# Altium schematic sheet Sheet1.SchDoc: ИЛ1424ТО1/1
size 410 x 297 mm; ApprovedBy: Стерхов В.Д; CheckedBy: Стерхов В.Д; Author: Сергеев Д.А.; CompanyName: ГК "СНАБЖЕНИЕ"; DrawnBy: Сергеев Д.А.; Engineer: Сергеев Д.А.; Organization: ГК "СНАБЖЕНИЕ"; DocumentNumber: ИЛ1424ТО1/1; SheetNumber: 1; SheetTotal: 1
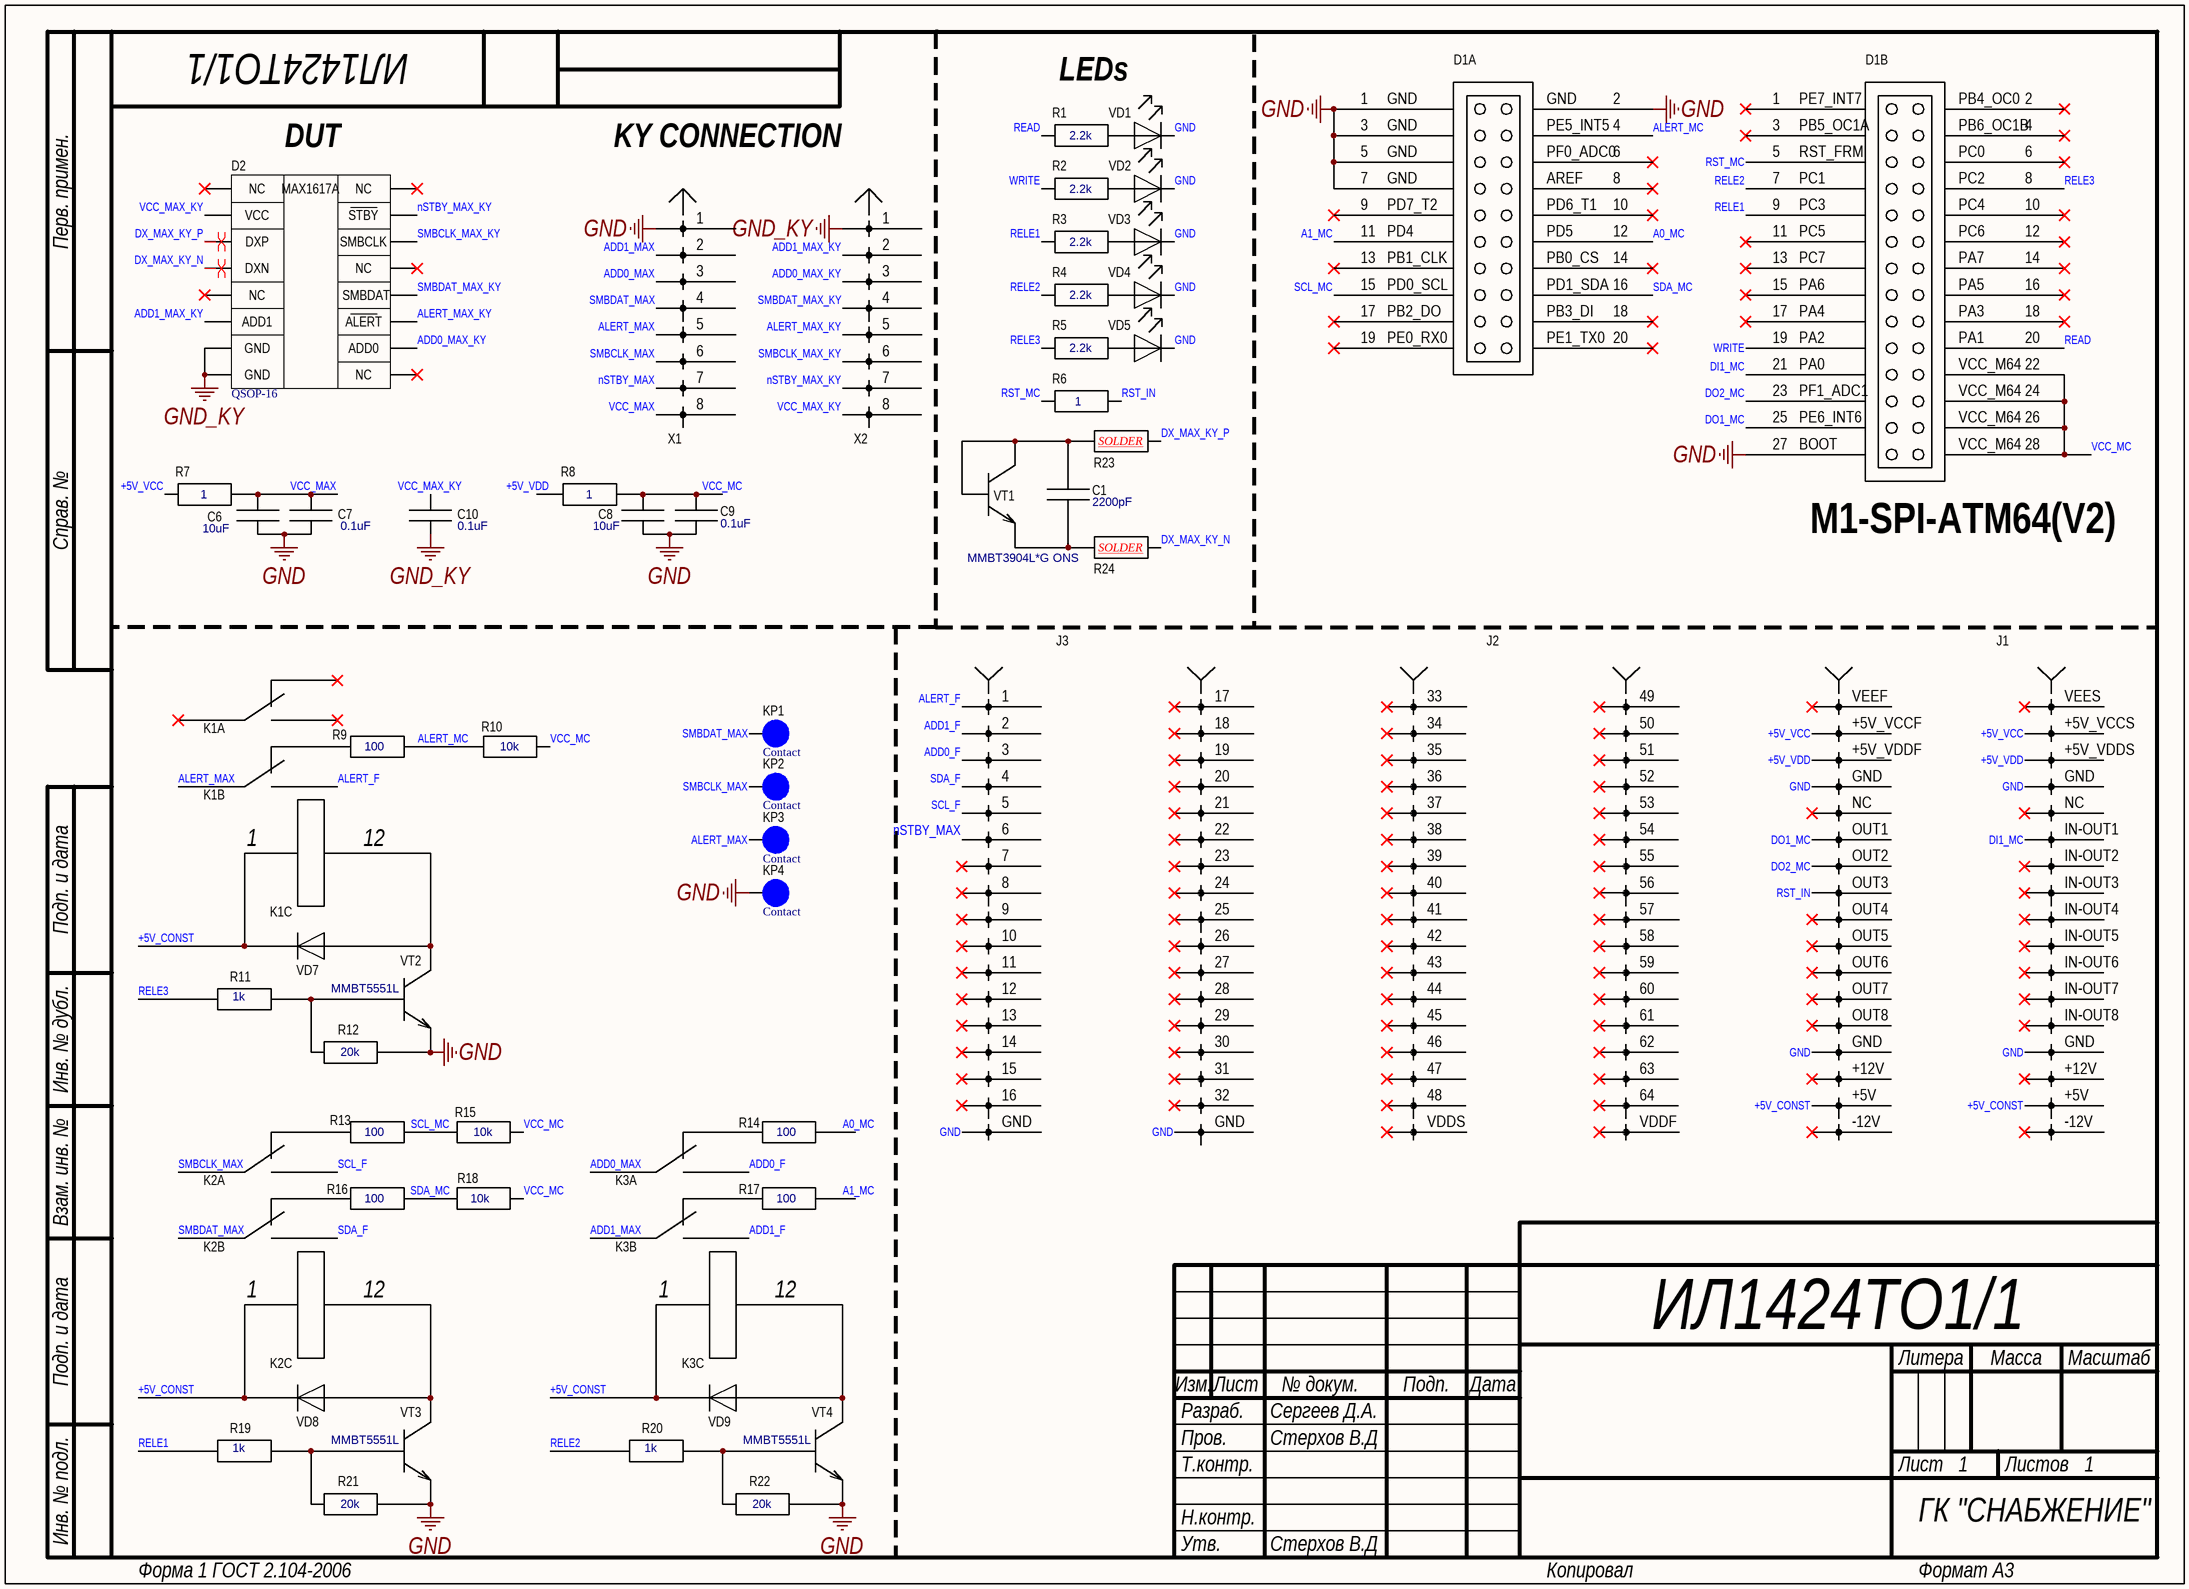
[diagram p0: Sheet1.SchDoc]

## Parts
C1  2200pF  [0603]
C6  10uF  [0805]
C7  0.1uF  [0805]
C8  10uF  [0805]
C9  0.1uF  [0805]
C10  0.1uF  [0805]
D1  M1-SPI-ATM64(V2)  [M1-SPI-ATM64(V2)]  (value not drawn)  (parts A,B of 2)
D2  QSOP-16  [QSOP-16 to DIP-7.62]
K1  V23079A1001B301 TE  [V23079A1001B301]  (value not drawn)  (parts A,B,C of 3)
K2  V23079A1001B301 TE  [V23079A1001B301]  (value not drawn)  (parts A,B,C of 3)
K3  V23079A1001B301 TE  [V23079A1001B301]  (value not drawn)  (parts A,B,C of 3)
KP1  Contact  [Contact]
KP2  Contact  [Contact]
KP3  Contact  [Contact]
KP4  Contact  [Contact]
R1  2.2k  [0805]
R2  2.2k  [0805]
R3  2.2k  [0805]
R4  2.2k  [0805]
R5  2.2k  [0805]
R6  1  [0805]
R7  1  [0805]
R8  1  [0805]
R9  100  [0805]
R10  10k  [0805]
R11  1k  [0805]
R12  20k  [0805]
R13  100  [0805]
R14  100  [0805]
R15  10k  [0805]
R16  100  [0805]
R17  100  [0805]
R18  10k  [0805]
R19  1k  [0805]
R20  1k  [0805]
R21  20k  [0805]
R22  20k  [0805]
R23  SOLDER  [0603]
R24  SOLDER  [0603]
VD1  LED(0805)  [0805(LED)]  (value not drawn)
VD2  LED(0805)  [0805(LED)]  (value not drawn)
VD3  LED(0805)  [0805(LED)]  (value not drawn)
VD4  LED(0805)  [0805(LED)]  (value not drawn)
VD5  LED(0805)  [0805(LED)]  (value not drawn)
VD7  LL4148 NXP  [SOD80C]  (value not drawn)
VD8  LL4148 NXP  [SOD80C]  (value not drawn)
VD9  LL4148 NXP  [SOD80C]  (value not drawn)
VT1  MMBT3904L*G ONS  [SOT-23]
VT2  MMBT5551L  [SOT-23]
VT3  MMBT5551L  [SOT-23]
VT4  MMBT5551L  [SOT-23]
X1  PLD8-2,54  [PLD8-2,54]  (value not drawn)
X2  PLD8-2,54  [PLD8-2,54]  (value not drawn)
X3  FORMULA  [FORMULA]  (value not drawn)

## Nets
GND: C6.2 C7.2 C8.2 C9.2 D1.1X2 D1.2X2 D1.3X2 D1.5X2 D1.7X2 D1.27X3 KP4.1 R12.2 R21.2 R22.2 VD1.2(K) VD2.2(K) VD3.2(K) VD4.2(K) VD5.2(K) VT2.2(E) VT3.2(E) VT4.2(E) X1.1 X3.GND
GND_KY: C10.2 D2.7 D2.8 X2.1
+5V_CONST: K1.1 K2.1 K3.1 VD7.2(K) VD8.2(K) VD9.2(K) X3.+5V
+5V_VCC: R7.1 X3.+5V_VCCF(VCCF) X3.+5V_VCCS(VCCS)
+5V_VDD: R8.1 X3.+5V_VDDF(VDDF) X3.+5V_VDDS(VDDS)
A0_MC: D1.12X2 R14.2
A1_MC: D1.11X2 R17.2
ADD0_F: K3.5 X3.3
ADD0_MAX: K3.4 X1.3
ADD0_MAX_KY: D2.10 X2.3
ADD1_F: K3.8 X3.2
ADD1_MAX: K3.9 X1.2
ADD1_MAX_KY: D2.6 X2.2
ALERT_F: K1.8 X3.1
ALERT_MAX: K1.9 KP3.1 X1.5
ALERT_MAX_KY: D2.11 X2.5
ALERT_MC: D1.4X2 R9.2 R10.1
DI1_MC: D1.21X3 X3.IN-OUT1
DO1_MC: D1.25X3 X3.OUT1
DO2_MC: D1.23X3 X3.OUT2
DX_MAX_KY_N: D2.4 R24.2
DX_MAX_KY_P: D2.3 R23.2
nSTBY_MAX: X1.7 X3.6
nSTBY_MAX_KY: D2.15 X2.7
READ: D1.20X3 R1.1
RELE1: D1.9X3 R3.1 R19.1
RELE2: D1.7X3 R4.1 R20.1
RELE3: D1.8X3 R5.1 R11.1
RST_IN: R6.2 X3.OUT3
RST_MC: D1.5X3 R6.1
SCL_F: K2.5 X3.5
SCL_MC: D1.15X2 R13.2 R15.1
SDA_F: K2.8 X3.4
SDA_MC: D1.16X2 R16.2 R18.1
SMBCLK_MAX: K2.4 KP2.1 X1.6
SMBCLK_MAX_KY: D2.14 X2.6
SMBDAT_MAX: K2.9 KP1.1 X1.4
SMBDAT_MAX_KY: D2.12 X2.4
VCC_MAX: C6.1 C7.1 R7.2 X1.8
VCC_MAX_KY: C10.1 D2.2 X2.8
VCC_MC: C8.1 C9.1 D1.22X3 D1.24X3 D1.26X3 D1.28X3 R8.2 R10.2 R15.2 R18.2
WRITE: D1.19X3 R2.1
NetC1_1: C1.1 R23.1 VT1.1(B) VT1.3(K)
NetC1_2: C1.2 R24.1 VT1.2(E)
NetK1_10: K1.10 R9.1
NetK1_12: K1.12 VD7.1(A) VT2.3(K)
NetK2_3: K2.3 R13.1
NetK2_10: K2.10 R16.1
NetK2_12: K2.12 VD8.1(A) VT3.3(K)
NetK3_3: K3.3 R14.1
NetK3_10: K3.10 R17.1
NetK3_12: K3.12 VD9.1(A) VT4.3(K)
NetR1_2: R1.2 VD1.1(A)
NetR2_2: R2.2 VD2.1(A)
NetR3_2: R3.2 VD3.1(A)
NetR4_2: R4.2 VD4.1(A)
NetR5_2: R5.2 VD5.1(A)
NetR11_2: R11.2 R12.1 VT2.1(B)
NetR19_2: R19.2 R21.1 VT3.1(B)
NetR20_2: R20.2 R22.1 VT4.1(B)

Not connected (* = marked no-connect by the designer): D1 1X3* 2X3* 3X3* 4X3* 6X2* 6X3* 8X2* 9X2* 10X2* 10X3* 11X3* 12X3* 13X2* 13X3* 14X2* 14X3* 15X3* 16X3* 17X2* 17X3* 18X2* 18X3* 19X2* 20X2*; D2 1* 5* 9* 13* 16*; K1 3* 4* 5*; X3 7* 8* 9* 10* 11* 12* 13* 14* 15* 16* 17* 18* 19* 20* 21* 22* 23* 24* 25* 26* 27* 28* 29* 30* 31* 32* 33* 34* 35* 36(4)* 37(5)* 38* 39* 40* 41* 42* 43* 44* 45* 46* 47* 48* 49* 50* 51* 52* 53* 54* 55* 56* 57* 58* 59* 60* 61* 62* 63* 64* +12V* -12V* IN-OUT2* IN-OUT3* IN-OUT4* IN-OUT5* IN-OUT6* IN-OUT7* IN-OUT8* NC* OUT4* OUT5* OUT6* OUT7* OUT8* VDDF* VDDS* VEEF* VEES*

## Layout directives
differential pair: DX_MAX_KY_N, DX_MAX_KY_P

## Notes on the sheet
- LEDs
- (near D2) DUT
- KY CONNECTION
- (near D1) M1-SPI-ATM64(V2)
- Перв. примен.
- Справ. №
- Подп. и дата
- Инв. № дубл.
- Взам. инв. №
- Разраб.
- Изм.
- Лист
- № докум.
- Подп.
- Дата
- Литера
- Масса
- Масштаб
- Пров.
- Т.контр.
- Листов
- Инв. № подл.
- Н.контр.
- Утв.
- Форма 1 ГОСТ 2.104-2006
- Копировал
- Формат А3
- (in symbol FORMULA) J3; J2; J1
- (in symbol M1-SPI-ATM64(V2), part A) GND; 3; PE5_INT5; 4; 5; PF0_ADC0; 6; 7; AREF; 8; 9; PD7_T2; PD6_T1; 10; 11; PD4; PD5; 12; 13; PB1_CLK; PB0_CS; 14; 15; PD0_SCL; PD1_SDA; 16; 17; PB2_DO; PB3_DI; 18; 19; PE0_RX0; PE1_TX0; 20
- (in symbol M1-SPI-ATM64(V2), part B) PE7_INT7; PB4_OC0; 3; PB5_OC1A; PB6_OC1B; 4; 5; RST_FRM; PC0; 6; 7; PC1; PC2; 8; 9; PC3; PC4; 10; 11; PC5; PC6; 12; 13; PC7; PA7; 14; 15; PA6; PA5; 16; 17; PA4; PA3; 18; 19; PA2; PA1; 20; 21; PA0; VCC_M64; 22; 23; PF1_ADC1; 24; 25; PE6_INT6; 26; 27; BOOT; 28
- (in symbol MAX1617) NC; MAX1617A; VCC; STBY; DXP; SMBCLK; DXN; SMBDAT; ADD1; ALERT; GND; ADD0

## Library data of the parts
C1 = C0603: ComponentHeigt: 1.3; Firme: AVX; Leadform: SMD; KIND: Конденсатор; ClassName: *; Component Link: *; ComponentWeigt: *; Packaging: 0805; NN: *; Value: *
C6-C10 = C0805: ComponentHeigt: 1.3; Firme: AVX; Leadform: SMD; KIND: Конденсатор; ClassName: *; Component Link: *; ComponentWeigt: *; Packaging: 0805; NN: *; Value: *
D1 = M1-SPI-ATM64(V2): ComponentHeigt: 5.5; Name: Вилка; Specification: Вилка PLD2-2 *; Typ: PLD2-2; ClassName: *; Component Link: *; ComponentWeigt: *; Firme: *; Leadform: *; NN: *; KIND: *
D2 = MAX1617
R1-R22 = R0805 Yageo: ComponentHeigt: 0.6; Firme: Yageo; Leadform: SMD; Kind: Резистор; ClassName: *; ComponentWeigt: *; Component Link: *; Packaging: 0805; NN: *; Value: *
R23 R24 = R0603 Yageo: ComponentHeigt: 0.5; Leadform: SMD; Firme: Yageo; Kind: Резистор; Packaging: 0402; ClassName: *; Component Link: *; NN: *
VD1-VD5 = LED(0805): ComponentHeigt: 0.75; Leadform: в отверстия; Firme: Kingbright; NN: 24003000; KIND: Светодиод L-1154GD Kingbright; Component Link: *; ClassName: *
VD7-VD9 = LL4148 NXP: ComponentHeigt: 1.6; Leadform: SMD; NN: 24009301; KIND: Диод LL4148 NXP; Component Link: http://www.nxp.com; Packaging: SOD-80C; ClassName: *; Firme: NXP
VT1 = MMBT3904L*G ONS: ComponentHeigt: 1.1; Leadform: SMD; NN: 24006226; KIND: Транзистор MMBT3904L*G ONS; ClassName: *; ComponentWeigt: *; Firme: ONS; Packaging: SOT-23
VT2-VT4 = MMBT5551L: ComponentHeigt: 1.1; Firme: ONS; Leadform: SMD; NN: 24007468; KIND: Транзистор MMBT5551L*G ONS; ClassName: *; ComponentWeigt: *; Packaging: SOT-23
X1 X2 = PLD8-2,54: ComponentHeigt: 5.5; Name: Вилка; Specification: Вилка PLD2-2 *; Typ: PLD2-2; ClassName: *; Component Link: *; ComponentWeigt: *; Firme: *; Leadform: *; NN: *; KIND: *